# Altium project 48MHz_timer.PrjPcb
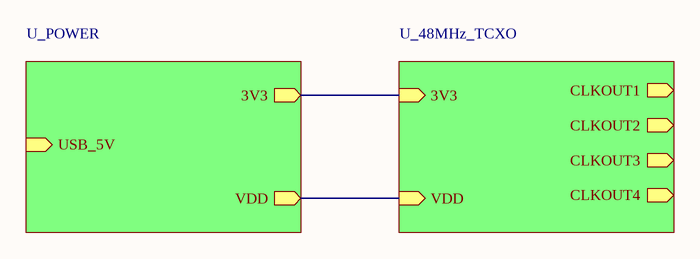
[diagram p0: top.SchDoc]
3 sheets, 50 parts. Net scope: hierarchical (ports join the sheet entries above them; power ports are global).
Board file: 48MHz1-4_TCXO.PcbDoc
Sheets:
  top.SchDoc
    U_POWER = POWER.SchDoc
    U_48MHz_TCXO = 48MHz_TCXO.SchDoc

## Sheet top.SchDoc
size A2; SheetNumber: 1; SheetTotal: 4

### Sub-sheets
U_48MHz_TCXO = 48MHz_TCXO.SchDoc: 3V3 (in), VDD (in), CLKOUT1 (out), CLKOUT2 (out), CLKOUT3 (out), CLKOUT4 (out)
U_POWER = POWER.SchDoc: 3V3 (out), VDD (out), USB_5V (in)

### Nets
VDD: sheet U_POWER/VDD, sheet U_48MHz_TCXO/VDD
NetC3_1: sheet U_POWER/3V3, sheet U_48MHz_TCXO/3V3

## Sheet POWER.SchDoc
size A2; SheetNumber: 3; SheetTotal: 3
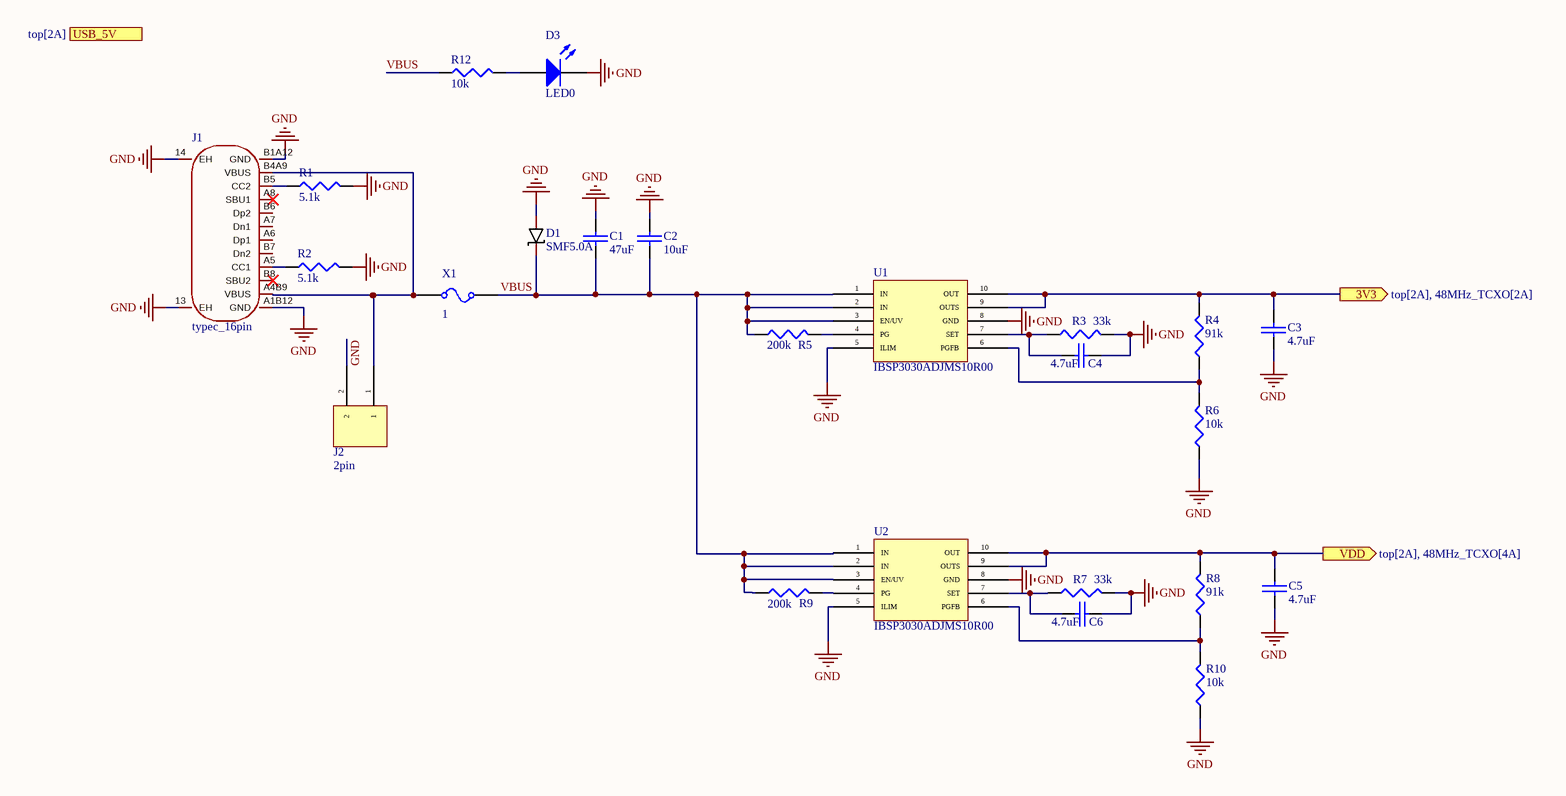
[diagram p1: POWER.SchDoc]

### Parts
C1  47uF  [0402_Z]
C2  10uF  [0603_Z]
C3  4.7uF  [0603_Z]
C4  4.7uF  [0603_Z]
C5  4.7uF  [0603_Z]
C6  4.7uF  [0603_Z]
D1  SMF5.0A  [SMF5.0A]
D3  LED0  [0603_Z]
J1  typec_16pin  [TYPEC_16PIN]
J2  2pin  [H2-2mm]
R1  5.1k  [0402_Z]
R2  5.1k  [0402_Z]
R3  33k  [0402_Z]
R4  91k  [0402_Z]
R5  200k  [0402_Z]
R6  10k  [0402_Z]
R7  33k  [0402_Z]
R8  91k  [0402_Z]
R9  200k  [0402_Z]
R10  10k  [0402_Z]
R12  10k  [0402_Z]
U1  IBSP3030ADJMS10R00  [IBSP3030ADJMS10R00]
U2  IBSP3030ADJMS10R00  [IBSP3030ADJMS10R00]
X1  CURRENT: 1  [F1206]  (hidden comment: Fuse)

### Ports
3V3 (out, see top[2A], 48MHz_TCXO[2A]), USB_5V (in, see top[2A]), VDD (out, see top[2A], 48MHz_TCXO[4A])

### Nets
GND: C1.1 C2.1 C3.2 C4.1 C5.2 C6.1 D1.2 D3.2(K) J1.13(EH) J1.14(EH) J1.A1B12(GND) J1.B1A12(GND) J2.2 R1.2 R2.2 R3.2 R6.1 R7.2 R10.1 U1.5(ILIM) U1.8(GND) U2.5(ILIM) U2.8(GND)
VDD: C5.1 R8.2 U2.9(OUTS) U2.10(OUT) ; port VDD
VBUS: C1.2 C2.2 D1.1 R5.1 R9.1 R12.1 U1.1(IN) U1.2(IN) U1.3(EN/UV) U2.1(IN) U2.2(IN) U2.3(EN/UV) X1.1
NetC3_1: C3.1 R4.2 U1.9(OUTS) U1.10(OUT) ; port 3V3
NetC4_2: C4.2 R3.1 U1.7(SET)
NetC6_2: C6.2 R7.1 U2.7(SET)
NetD3_1: D3.1(A) R12.2
NetJ1_A4B9: J1.A4B9(VBUS) J1.B4A9(VBUS) J2.1 X1.2
NetJ1_A5: J1.A5(CC1) R2.1
NetJ1_B5: J1.B5(CC2) R1.1
NetR4_1: R4.1 R6.2 U1.6(PGFB)
NetR5_2: R5.2 U1.4(PG)
NetR8_1: R8.1 R10.2 U2.6(PGFB)
NetR9_2: R9.2 U2.4(PG)

Not connected (* = marked no-connect by the designer): J1 A6(Dp1) A7(Dn1) A8(SBU1)* B6(Dp2) B7(Dn2) B8(SBU2)*

### Library data of the parts
C1 = CAP: 0805; Value: 20pF  NP0
C2 = CAP: 0603; Value: 20pF  NP0
C3-C6 = CAP: 0402; Value: 20pF  NP0
D3 = LED0: Typical INFRARED GaAs LED; Published: 8-Jun-2000; LatestRevisionDate: 08-Jul-2005; LatestRevisionNote: Mech Layer 1 removed.; PackageReference: LED-0; Publisher: Altium Limited; PackageDescription: LED; 2 Leads
R1-R10 R12 = Res3: Resistor; Published: 8-Jun-2000; LatestRevisionDate: 04-Mar-2005; LatestRevisionNote: PCB Footprint replaced.; PackageReference: J1-0603; Publisher: Altium Limited
  R1 R2: Value: 5.1k
  R3 R7: Value: 33k
  R4 R8: Value: 91k
  R5 R9: Value: 200k
  R6 R10 R12: Value: 10k
X1 = Fuse: RESISTANCE: 1m; SimulationGenericComponent: True

## Sheet 48MHz_TCXO.SchDoc
size A2; SheetNumber: 2; SheetTotal: 3
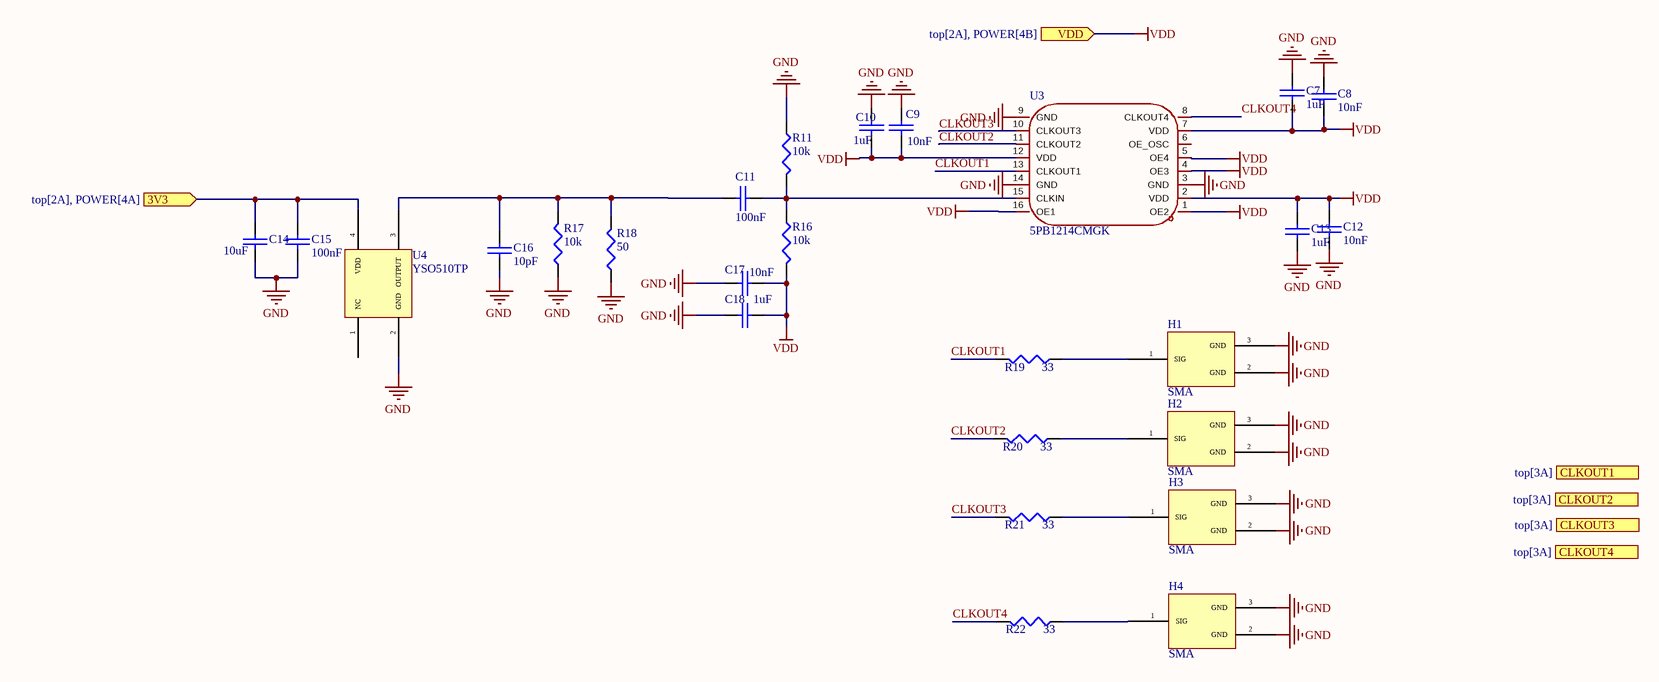
[diagram p2: 48MHz_TCXO.SchDoc]

### Parts
C7  1uF  [0603_Z]
C8  10nF  [0402_Z]
C9  10nF  [0402_Z]
C10  1uF  [0402_Z]
C11  100nF  [0402_Z]
C12  10nF  [0402_Z]
C13  1uF  [0402_Z]
C14  10uF  [0402_Z]
C15  100nF  [0402_Z]
C16  10pF  [0402_Z]
C17  10nF  [0402_Z]
C18  1uF  [0402_Z]
H1  SMA  [SMA-SMD]
H2  SMA  [SMA-SMD]
H3  SMA  [SMA-SMD]
H4  SMA  [SMA-SMD]
R11  10k  [0402_Z]
R16  10k  [0402_Z]
R17  10k  [0402_Z]
R18  50  [0402_Z]
R19  33  [0402_Z]
R20  33  [0402_Z]
R21  33  [0402_Z]
R22  33  [0402_Z]
U3  5PB1214CMGK  [5PB1214CMGK]
U4  YSO510TP  [48MH温补晶振]

### Ports
3V3 (in, see top[2A], POWER[4A]), CLKOUT1 (out, see top[3A]), CLKOUT2 (out, see top[3A]), CLKOUT3 (out, see top[3A]), CLKOUT4 (out, see top[3A]), VDD (in, see top[2A], POWER[4B])

### Nets
GND: C7.2 C8.1 C9.2 C10.1 C12.1 C13.1 C14.1 C15.2 C16.2 C17.2 C18.2 H1.2(GND) H1.3(GND) H2.2(GND) H2.3(GND) H3.2(GND) H3.3(GND) H4.2(GND) H4.3(GND) R11.1 R17.1 R18.1 U3.3(GND) U3.9(GND) U3.14(GND) U4.2(GND)
VDD: C7.1 C8.2 C9.1 C10.2 C12.2 C13.2 C17.1 C18.1 R16.2 U3.1(OE2) U3.2(VDD) U3.4(OE3) U3.5(OE4) U3.7(VDD) U3.12(VDD) U3.16(OE1) ; port VDD
CLKOUT1: R19.2 U3.13(CLKOUT1)
CLKOUT2: R20.2 U3.11(CLKOUT2)
CLKOUT3: R21.2 U3.10(CLKOUT3)
CLKOUT4: R22.2 U3.8(CLKOUT4)
NetC3_1: C14.2 C15.1 U4.4(VDD) ; port 3V3
NetC11_1: C11.1 R11.2 R16.1 U3.15(CLKIN)
NetC11_2: C11.2 C16.1 R17.2 R18.2 U4.3(OUTPUT)
NetH1_1: H1.1(SIG) R19.1
NetH2_1: H2.1(SIG) R20.1
NetH3_1: H3.1(SIG) R21.1
NetH4_1: H4.1(SIG) R22.1

Not connected (* = marked no-connect by the designer): U3 6(OE_OSC); U4 1(NC)

### Library data of the parts
C7-C13 C15-C18 = CAP: 0402; Value: 20pF  NP0
C14 = CAP: 0603; Value: 20pF  NP0
H1-H4 = SMA: BWSMA-KE-P001
R11 R16-R22 = Res3: Resistor; Published: 8-Jun-2000; LatestRevisionDate: 04-Mar-2005; LatestRevisionNote: PCB Footprint replaced.; PackageReference: J1-0603; Publisher: Altium Limited
  R11 R16 R17: Value: 10k
  R18: Value: 50
  R19-R22: Value: 33
U3 = 5PB1214CMGK8
U4 = 48MHz温补晶振

## Nets that join several sheets
GND: POWER (23 pins), 48MHz_TCXO (26 pins)
VDD: POWER (C5.1 R8.2 U2.9 U2.10), 48MHz_TCXO (16 pins)
NetC3_1: POWER (C3.1 R4.2 U1.9 U1.10), 48MHz_TCXO (C14.2 C15.1 U4.4)